# Altium schematic sheet 实验项目二.SchDoc
size A4
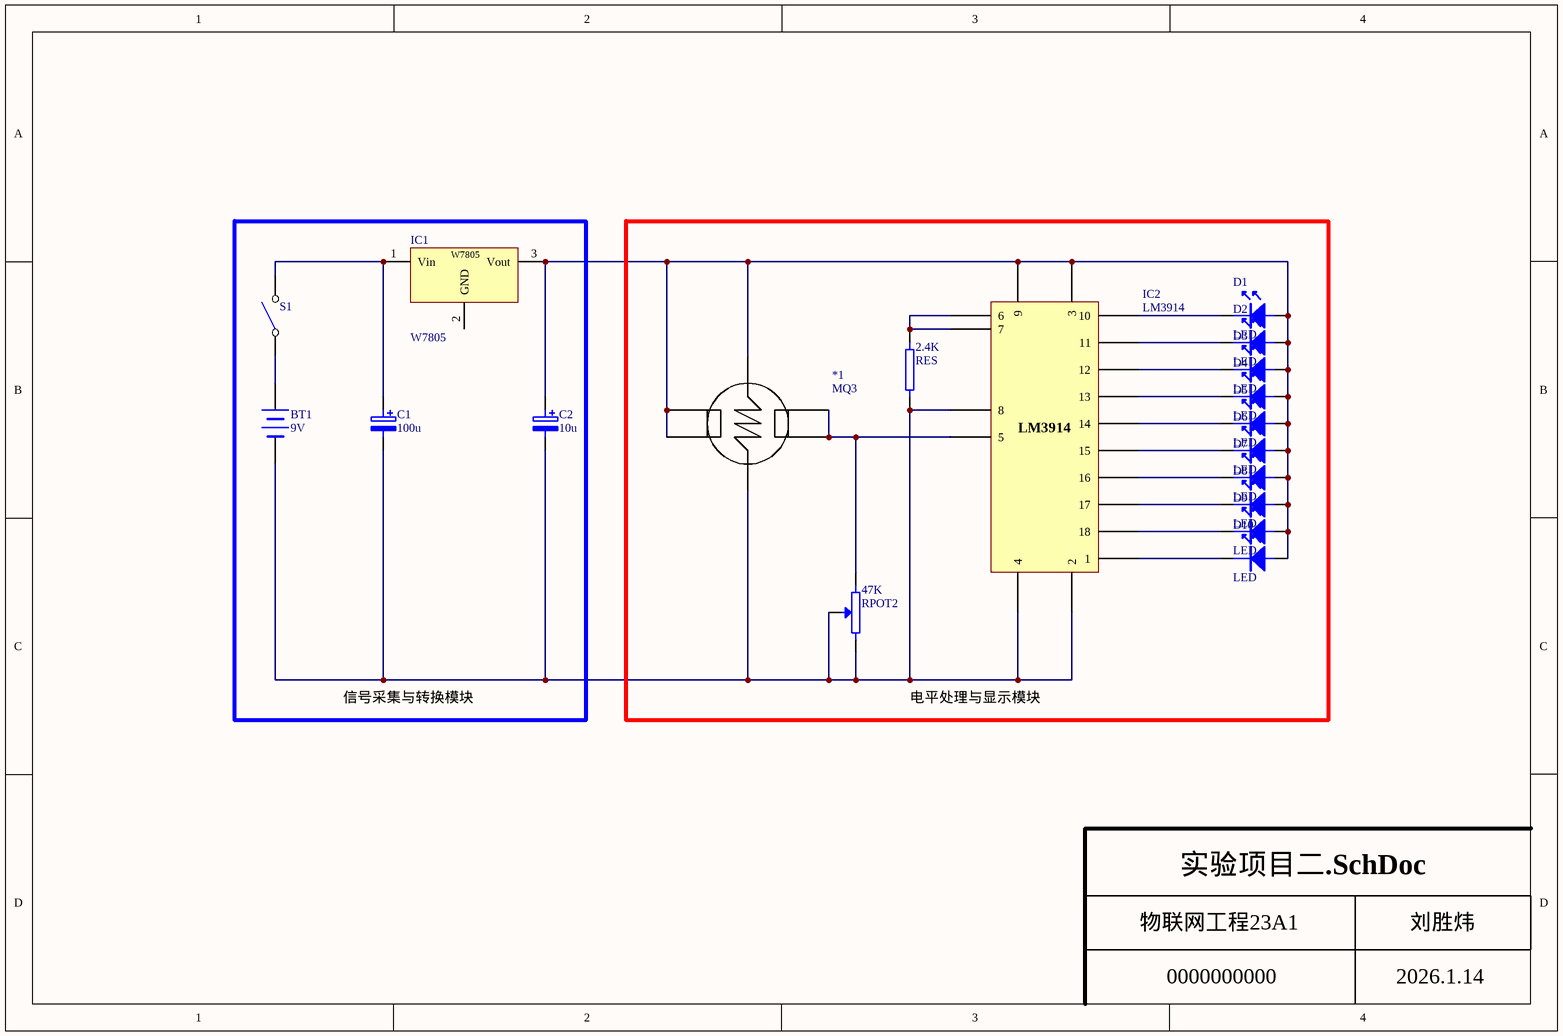
[diagram p0: 实验项目二.SchDoc]

## Parts
2.4K  RES  [AXIAL0.4]
47K  RPOT2  [VR5]
*1  MQ3
BT1  9V
C1  100u  [CD5]
C2  10u  [CD5]
D1  LED  [LED]
D2  LED  [LED]
D3  LED  [LED]
D4  LED  [LED]
D5  LED  [LED]
D6  LED  [LED]
D7  LED  [LED]
D8  LED  [LED]
D9  LED  [LED]
D10  LED  [LED]
IC1  W7805  [TO126]
IC2  LM3914  [DIP-18]
S1  Switch  (value not drawn)

## Blocks framed on the sheet
信号采集与转换模块: BT1 C1 C2 IC1 S1
电平处理与显示模块: 2.4K 47K *1 D1-D10 IC2

## Nets
Net2.4K_1: 2.4K.1 47K.1 47K.2(VT) *1.2 BT1.2(-) C1.2 C2.2 IC2.2 IC2.4 IC2.8
Net2.4K_2: 2.4K.2 IC2.6 IC2.7
Net47K_3: 47K.3 *1.5 *1.6 IC2.5
Net*1_1: *1.1 *1.3 *1.4 C2.1 D1.1 D2.1 D3.1 D4.1 D5.1 D6.1 D7.1 D8.1 D9.1 D10.1 IC1.3(Vout) IC2.3 IC2.9
NetBT1_1: BT1.1(+) S1.1
NetC1_1: C1.1 IC1.1(Vin) S1.2
NetD1_2: D1.2 IC2.10
NetD2_2: D2.2 IC2.11
NetD3_2: D3.2 IC2.12
NetD4_2: D4.2 IC2.13
NetD5_2: D5.2 IC2.14
NetD6_2: D6.2 IC2.15
NetD7_2: D7.2 IC2.16
NetD8_2: D8.2 IC2.17
NetD9_2: D9.2 IC2.18
NetD10_2: D10.2 IC2.1

Not connected (* = marked no-connect by the designer): IC1 2(GND)

## Notes on the sheet
- 物联网工程23A1
- 0000000000
- 2026.1.14
- 刘胜炜

## Library data of the parts
47K = RPOT2: Potentiometer
BT1 = BATTERY
C1 C2 = CD